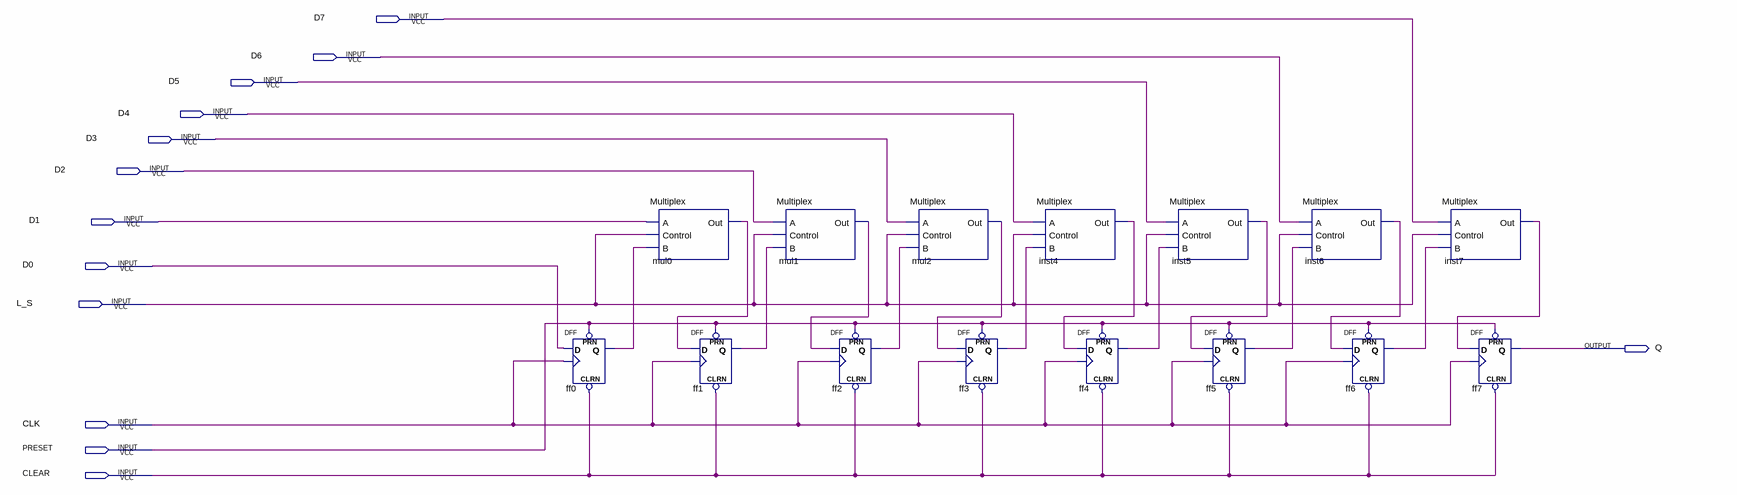
[diagram p0: schematic sheet]
// Quartus schematic PISO.bdf as structural Verilog: 15 symbols, 13 pins
module PISO (
  input  D7,
  input  D6,
  input  D5,
  input  D4,
  input  D3,
  input  D2,
  input  D1,
  input  D0,
  input  L_S,
  input  CLK,
  input  PRESET,
  input  CLEAR,
  output Q
);

  wire ff0_q, ff1_q, ff2_q, ff3_q, ff4_q, ff5_q, ff6_q, inst4_out, inst5_out, inst6_out, inst7_out, mul0_out,
       mul1_out, mul2_out;

  DFF ff0 (.CLRN(CLEAR), .CLK(CLK), .D(D0), .PRN(PRESET), .Q(ff0_q));
  Multiplex mul0 (.A(D1), .Control(L_S), .B(ff0_q), .Out(mul0_out));
  DFF ff1 (.CLRN(CLEAR), .CLK(CLK), .D(mul0_out), .PRN(PRESET), .Q(ff1_q));
  Multiplex mul1 (.A(D2), .Control(L_S), .B(ff1_q), .Out(mul1_out));
  DFF ff2 (.CLRN(CLEAR), .CLK(CLK), .D(mul1_out), .PRN(PRESET), .Q(ff2_q));
  Multiplex mul2 (.A(D3), .Control(L_S), .B(ff2_q), .Out(mul2_out));
  DFF ff3 (.CLRN(CLEAR), .CLK(CLK), .D(mul2_out), .PRN(PRESET), .Q(ff3_q));
  Multiplex inst4 (.A(D4), .Control(L_S), .B(ff3_q), .Out(inst4_out));
  DFF ff4 (.CLRN(CLEAR), .CLK(CLK), .D(inst4_out), .PRN(PRESET), .Q(ff4_q));
  Multiplex inst5 (.A(D5), .Control(L_S), .B(ff4_q), .Out(inst5_out));
  DFF ff5 (.CLRN(CLEAR), .CLK(CLK), .D(inst5_out), .PRN(PRESET), .Q(ff5_q));
  Multiplex inst6 (.A(D6), .Control(L_S), .B(ff5_q), .Out(inst6_out));
  DFF ff6 (.CLRN(CLEAR), .CLK(CLK), .D(inst6_out), .PRN(PRESET), .Q(ff6_q));
  Multiplex inst7 (.A(D7), .Control(L_S), .B(ff6_q), .Out(inst7_out));
  DFF ff7 (.CLRN(CLEAR), .CLK(CLK), .D(inst7_out), .PRN(PRESET), .Q(Q));
endmodule
